# Altium schematic sheet THREE PHASES.SchDoc
size A4; SheetNumber: 2; SheetTotal: 6
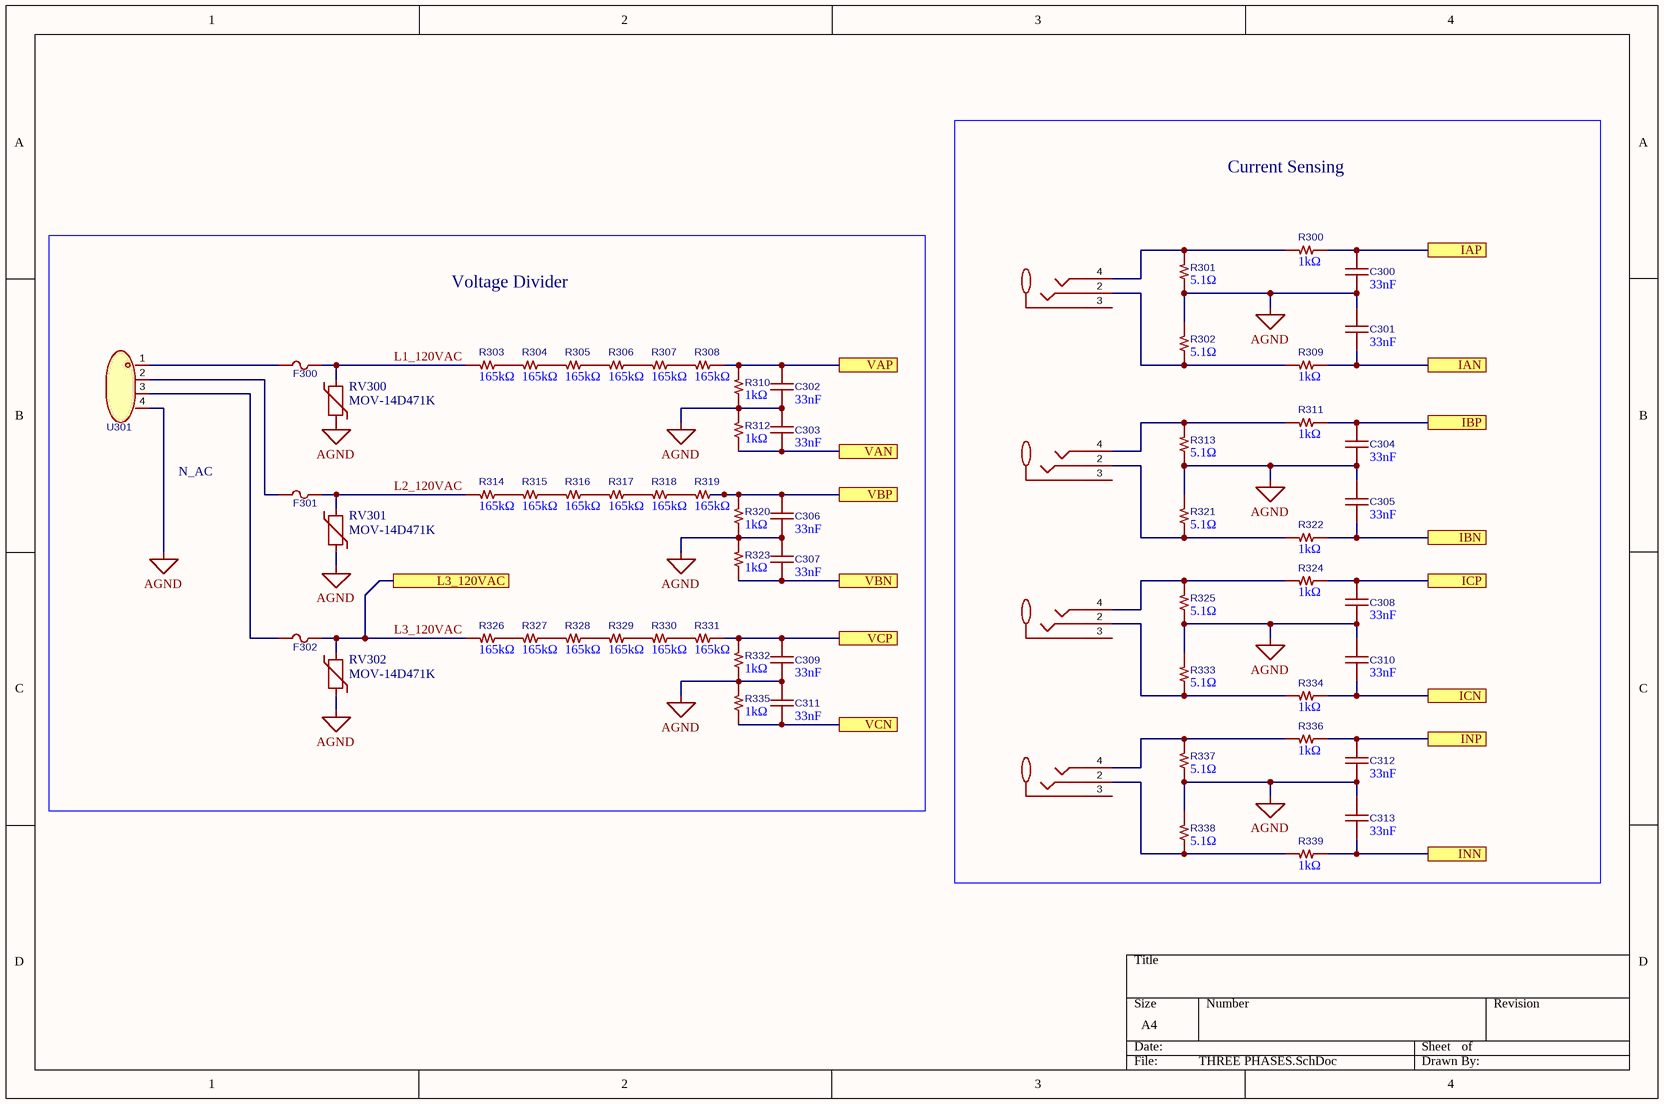
[diagram p0: THREE PHASES.SchDoc]

## Parts
C300  value 33nF  [0603_cap]  (hidden comment: AIDE CAPACITOR 0603X7R333J500NT)
C301  value 33nF  [0603_cap]  (hidden comment: AIDE CAPACITOR 0603X7R333J500NT)
C302  value 33nF  [0603_cap]  (hidden comment: AIDE CAPACITOR 0603X7R333J500NT)
C303  value 33nF  [0603_cap]  (hidden comment: AIDE CAPACITOR 0603X7R333J500NT)
C304  value 33nF  [0603_cap]  (hidden comment: AIDE CAPACITOR 0603X7R333J500NT)
C305  value 33nF  [0603_cap]  (hidden comment: AIDE CAPACITOR 0603X7R333J500NT)
C306  value 33nF  [0603_cap]  (hidden comment: AIDE CAPACITOR 0603X7R333J500NT)
C307  value 33nF  [0603_cap]  (hidden comment: AIDE CAPACITOR 0603X7R333J500NT)
C308  value 33nF  [0603_cap]  (hidden comment: AIDE CAPACITOR 0603X7R333J500NT)
C309  value 33nF  [0603_cap]  (hidden comment: AIDE CAPACITOR 0603X7R333J500NT)
C310  value 33nF  [0603_cap]  (hidden comment: AIDE CAPACITOR 0603X7R333J500NT)
C311  value 33nF  [0603_cap]  (hidden comment: AIDE CAPACITOR 0603X7R333J500NT)
C312  value 33nF  [0603_cap]  (hidden comment: AIDE CAPACITOR 0603X7R333J500NT)
C313  value 33nF  [0603_cap]  (hidden comment: AIDE CAPACITOR 0603X7R333J500NT)
F300  JDTfuse JFC2410-0200TS  [FUSE-SMD_L6.1-W2.7]  (value not drawn)
F301  JDTfuse JFC2410-0200TS  [FUSE-SMD_L6.1-W2.7]  (value not drawn)
F302  JDTfuse JFC2410-0200TS  [FUSE-SMD_L6.1-W2.7]  (value not drawn)
R300  value 1kΩ  [0603_RES]  (hidden comment: FOJAN FRC0603F1001TS)
R301  value 5.1Ω  [0603_RES]  (hidden comment: SEI(Stackpole Electronics Inc.))
R302  value 5.1Ω  [0603_RES]  (hidden comment: SEI(Stackpole Electronics Inc.))
R303  value 165kΩ  [0603_RES]  (hidden comment: BOURNS CR0603-FX-1653ELF)
R304  value 165kΩ  [0603_RES]  (hidden comment: BOURNS CR0603-FX-1653ELF)
R305  value 165kΩ  [0603_RES]  (hidden comment: BOURNS CR0603-FX-1653ELF)
R306  value 165kΩ  [0603_RES]  (hidden comment: BOURNS CR0603-FX-1653ELF)
R307  value 165kΩ  [0603_RES]  (hidden comment: BOURNS CR0603-FX-1653ELF)
R308  value 165kΩ  [0603_RES]  (hidden comment: BOURNS CR0603-FX-1653ELF)
R309  value 1kΩ  [0603_RES]  (hidden comment: FOJAN FRC0603F1001TS)
R310  value 1kΩ  [0603_RES]  (hidden comment: FOJAN FRC0603F1001TS)
R311  value 1kΩ  [0603_RES]  (hidden comment: FOJAN FRC0603F1001TS)
R312  value 1kΩ  [0603_RES]  (hidden comment: FOJAN FRC0603F1001TS)
R313  value 5.1Ω  [0603_RES]  (hidden comment: SEI(Stackpole Electronics Inc.))
R314  value 165kΩ  [0603_RES]  (hidden comment: BOURNS CR0603-FX-1653ELF)
R315  value 165kΩ  [0603_RES]  (hidden comment: BOURNS CR0603-FX-1653ELF)
R316  value 165kΩ  [0603_RES]  (hidden comment: BOURNS CR0603-FX-1653ELF)
R317  value 165kΩ  [0603_RES]  (hidden comment: BOURNS CR0603-FX-1653ELF)
R318  value 165kΩ  [0603_RES]  (hidden comment: BOURNS CR0603-FX-1653ELF)
R319  value 165kΩ  [0603_RES]  (hidden comment: BOURNS CR0603-FX-1653ELF)
R320  value 1kΩ  [0603_RES]  (hidden comment: FOJAN FRC0603F1001TS)
R321  value 5.1Ω  [0603_RES]  (hidden comment: SEI(Stackpole Electronics Inc.))
R322  value 1kΩ  [0603_RES]  (hidden comment: FOJAN FRC0603F1001TS)
R323  value 1kΩ  [0603_RES]  (hidden comment: FOJAN FRC0603F1001TS)
R324  value 1kΩ  [0603_RES]  (hidden comment: FOJAN FRC0603F1001TS)
R325  value 5.1Ω  [0603_RES]  (hidden comment: SEI(Stackpole Electronics Inc.))
R326  value 165kΩ  [0603_RES]  (hidden comment: BOURNS CR0603-FX-1653ELF)
R327  value 165kΩ  [0603_RES]  (hidden comment: BOURNS CR0603-FX-1653ELF)
R328  value 165kΩ  [0603_RES]  (hidden comment: BOURNS CR0603-FX-1653ELF)
R329  value 165kΩ  [0603_RES]  (hidden comment: BOURNS CR0603-FX-1653ELF)
R330  value 165kΩ  [0603_RES]  (hidden comment: BOURNS CR0603-FX-1653ELF)
R331  value 165kΩ  [0603_RES]  (hidden comment: BOURNS CR0603-FX-1653ELF)
R332  value 1kΩ  [0603_RES]  (hidden comment: FOJAN FRC0603F1001TS)
R333  value 5.1Ω  [0603_RES]  (hidden comment: SEI(Stackpole Electronics Inc.))
R334  value 1kΩ  [0603_RES]  (hidden comment: FOJAN FRC0603F1001TS)
R335  value 1kΩ  [0603_RES]  (hidden comment: FOJAN FRC0603F1001TS)
R336  value 1kΩ  [0603_RES]  (hidden comment: FOJAN FRC0603F1001TS)
R337  value 5.1Ω  [0603_RES]  (hidden comment: SEI(Stackpole Electronics Inc.))
R338  value 5.1Ω  [0603_RES]  (hidden comment: SEI(Stackpole Electronics Inc.))
R339  value 1kΩ  [0603_RES]  (hidden comment: FOJAN FRC0603F1001TS)
RV300  MOV-14D471K  [MOV14D471K]
RV301  MOV-14D471K  [MOV14D471K]
RV302  MOV-14D471K  [MOV14D471K]
U300  hx pj-320a-3p dip  [AUDIO-SMD_HX-PJ-320A-3P-DIP]  (value not drawn)
U301  c50126v-4p0g56  [CONN-TH_C50126V-4P0G56]  (value not drawn)
U302  hx pj-320a-3p dip  [AUDIO-SMD_HX-PJ-320A-3P-DIP]  (value not drawn)
U303  hx pj-320a-3p dip  [AUDIO-SMD_HX-PJ-320A-3P-DIP]  (value not drawn)
U304  hx pj-320a-3p dip  [AUDIO-SMD_HX-PJ-320A-3P-DIP]  (value not drawn)

## Blocks framed on the sheet
Current Sensing: C300 C301 C304 C305 C308 C310 C312 C313 R300-R302 R309 R311 R313 R321 R322 R324 R325 R333 R334 R336-R339 U300 U302-U304
Voltage Divider: C302 C303 C306 C307 C309 C311 F300-F302 R303-R308 R310 R312 R314-R320 R323 R326-R332 R335 RV300-RV302 U301

## Ports
IAN (see MAIN[1C], MEASURES[1C]), IAP (see MAIN[1C], MEASURES[1C]), IBN (see MAIN[1C], MEASURES[1C]), IBP (see MAIN[1C], MEASURES[1C]), ICN (see MAIN[1C], MEASURES[1C]), ICP (see MAIN[1C], MEASURES[1C]), INN (see MAIN[1C], MEASURES[1C]), INP (see MAIN[1C], MEASURES[1C]), L3_120VAC (see MAIN[1B], POWER[1B]), VAN (see MAIN[1B], MEASURES[1C]), VAP (see MAIN[1B], MEASURES[1C]), VBN (see MAIN[1B], MEASURES[1C]), VBP (see MAIN[1B], MEASURES[1C]), VCN (see MAIN[1B], MEASURES[1C]), VCP (see MAIN[1B], MEASURES[1C])

## Nets
AGND: C300.1 C301.2 C302.1 C303.2 C304.1 C305.2 C306.1 C307.2 C308.1 C309.1 C310.2 C311.2 C312.1 C313.2 R301.1 R302.2 R310.1 R312.2 R313.1 R320.1 R321.2 R323.2 R325.1 R332.1 R333.2 R335.2 R337.1 R338.2 RV300.2 RV301.2 RV302.2 U301.4
IAN: C301.1 R309.1 ; port IAN
IAP: C300.2 R300.1 ; port IAP
IBN: C305.1 R322.1 ; port IBN
IBP: C304.2 R311.1 ; port IBP
ICN: C310.1 R334.1 ; port ICN
ICP: C308.2 R324.1 ; port ICP
INN: C313.1 R339.1 ; port INN
INP: C312.2 R336.1 ; port INP
L1_120VAC: F300.2 R303.2 RV300.1
L2_120VAC: F301.2 R314.2 RV301.1
L3_120VAC: F302.2 R326.2 RV302.1 ; port L3_120VAC
VAN: C303.1 R312.1 ; port VAN
VAP: C302.2 R308.1 R310.2 ; port VAP
VBN: C307.1 R323.1 ; port VBN
VBP: C306.2 R319.1 R320.2 ; port VBP
VCN: C311.1 R335.1 ; port VCN
VCP: C309.2 R331.1 R332.2 ; port VCP
NetF300_1: F300.1 U301.1
NetF301_1: F301.1 U301.2
NetF302_1: F302.1 U301.3
NetR300_2: R300.2 R301.2 U300.4
NetR302_1: R302.1 R309.2 U300.2
NetR303_1: R303.1 R304.2
NetR304_1: R304.1 R305.2
NetR305_1: R305.1 R306.2
NetR306_1: R306.1 R307.2
NetR307_1: R307.1 R308.2
NetR311_2: R311.2 R313.2 U302.4
NetR314_1: R314.1 R315.2
NetR315_1: R315.1 R316.2
NetR316_1: R316.1 R317.2
NetR317_1: R317.1 R318.2
NetR318_1: R318.1 R319.2
NetR321_1: R321.1 R322.2 U302.2
NetR324_2: R324.2 R325.2 U303.4
NetR326_1: R326.1 R327.2
NetR327_1: R327.1 R328.2
NetR328_1: R328.1 R329.2
NetR329_1: R329.1 R330.2
NetR330_1: R330.1 R331.2
NetR333_1: R333.1 R334.2 U303.2
NetR336_2: R336.2 R337.2 U304.4
NetR338_1: R338.1 R339.2 U304.2

Not connected (* = marked no-connect by the designer): U300 3; U302 3; U303 3; U304 3

## Notes on the sheet
- N_AC

## Library data of the parts
C300-C313 = CAP_CER_33nF X7R ±5% 50V: 33nF X7R ±5% 50V 0603 Ceramic Capacitors RoHS; ComponentLink1Description: LCSC; ComponentLink1URL: https://www.lcsc.com/product-detail/C49326639.html?s_z=n_q_AIDE%2520CAPACITOR%25200603X7R333J500NT&spm=wm.fly.bg.0.xh&lcsc_vid=FFRdVwAETgNbVwAHTlRdV1UFEwcIU1ZXQVZZAlYFQAcxVlNfRlJdU1VSRlReXjsOAxUeFF5JWBYZEEoKFBINSQcJGk4LFEsFFhULAAsUDk5fVl1fWQkaCgg%3D; Supplier 1: LCSC; Manufacturer 1: AIDE CAPACITOR; Manufacturer Part Number 1: 0603X7R333J500NT; Supplier Part Number 1: C49326639
F300-F302 = FUSE_MOV_JFC2410: Surface Mount Fuse 200mA 250V 2410 Fuses; ComponentLink1Description: LCSC; ComponentLink1URL: https://www.lcsc.com/product-detail/C55058769.html?s_z=n_q_JFC2410-0200TS; Supplier 1: LCSC; Supplier Part Number 1: C55058769; Manufacturer 1: JDTfuse; Manufacturer Part Number 1: JFC2410-0200TS
R300 R309-R312 R320 R322-R324 R332 R334-R336 R339 = RES 1kohms ±1% 100mW 0603: RES 1kΩ ±1% 100mW 0603; ComponentLink1Description: New link; ComponentLink1URL: https://www.lcsc.com/es/product-detail/C2907002.html?spm=wm.fly.bg.1.xh___wm.fly.dhl.mly.13-6-1&lcsc_vid=T1EMUlBeR1ALUlVSFANeUFcFR1BWV1EHFVFaA1dQElAxVlNfRlJaV1FUQldbXzsOAxUeFF5JWBYZEEoKFBINSQcJGk4NBhYS; Supplier 1: LCSC; Supplier Part Number 1: C2907002; Manufacturer Part Number 1: FRC0603F1001TS; Manufacturer 1: FOJAN
R301 R302 R313 R321 R325 R333 R337 R338 = RES 5.1ohms ±1% 400mW 0603: RES 5.1Ω ±1% 400mW 0603; Manufacturer 1: UNI-ROYAL HQ03W5F510KT5E; Manufacturer Part Number 1: HQ03W5F510KT5E; Supplier Part Number 1: C2791987; Supplier 1: LCSC; ComponentLink1Description: New link; ComponentLink1URL: https://www.lcsc.com/es/product-detail/C2907011.html?spm=wm.fly.bg.0.xh___wm.fly.tp.1.ml&lcsc_vid=TlUKUVJeQVYNVVcAFQBcBQJfRlgPUVYCQllYVwUHEQcxVlNfRFRfUVJUQ1JcXzsOAxUeFF5JWBYZEEoKFBINSQcJGk4LFEs%3D
R303-R308 R314-R319 R326-R331 = RES 165k ±0.1% 100mW 0603: RES 165kΩ ±0.1% 100mW 0603; Manufacturer 1: YAGEO; Manufacturer Part Number 1: RT0603BRD07165KL; ComponentLink1Description: New link; ComponentLink1URL: https://www.lcsc.com/product-detail/C861150.html; Supplier Part Number 1: C861150; Supplier 1: LCSC
RV300-RV302 = MOV-14D471K: 470 V 4.5 kA Varistor 1 Circuit Through Hole Disc 14mm; Manufacturer 1: BOURNS; ComponentLink1Description: LCSC; ComponentLink1URL: https://www.lcsc.com/es/product-detail/C1527439.html?s_z=n_q_MOV-14D471K&spm=wm.fly.bg.0.xh&lcsc_vid=FFRdVwAETgNbVwAHTlRdV1UFEwcIU1ZXQVZZAlYFQAcxVlNfRlJdUlZRQlZXVjsOAxUeFF5JWBYZEEoKFBINSQcJGk4LFEsWBQ4KEgcSWgULEwUPG04tUlNXRlhYSQwSGg0%3D; Supplier 1: LCSC; Supplier Part Number 1: C1527439; ComponentLink2Description: Datasheet; ComponentLink2URL: https://www.lcsc.com/datasheet/C1527439.pdf; Manufacturer Part Number 1: MOV-14D471K
U300 U302-U304 = hx pj-320a-3p dip: Connector Type:3.5mm Headphone Jack Current Rating:500mA Voltage Rating (Max):30V Operating Temperature:-30℃~+70℃ Operating Temperature:-30℃~+70℃ Rank Number:TRS Mounting Style:Right-Angle Body Height:5mm Length:14.1mm Width:6mm; Manufacturer 1: hanxia; ComponentLink1Description: LCSC; ComponentLink1URL: https://www.lcsc.com/product-detail/C19189087.html?s_z=n_q_hx%2520pj-320a-3p%2520dip; Supplier 1: LCSC; Supplier Part Number 1: C19189087; Manufacturer Part Number 1: HX PJ-320A-3P DIP
U301 = BR_50126v-4p0g56: Number of Positions or Pins:1x4P Pitch:5mm Color:Green Mounting Type:Through Hole Number of Pins:4P Number of Rows:1 Number of PINs Per Row:4 Current Rating:18A Voltage Rating (Max):250V Wire Gauge - AWG:14~26 Wire Gauge - mm2:0.5~2.5 Wire Gauge - mm2:0.5; Manufacturer 1: JXTCONN; Color: Green; ComponentLink1Description: LCSC; ComponentLink1URL: https://www.lcsc.com/es/product-detail/C49291885.html?spm=wm.fly.bg.2.xh&lcsc_vid=QARXAVUEQ1ELXl1fE1ZXXgVfFgdaUV1TRAUKVFNRFFAxVlNfRlVdU1NQQFdcUTtW; Supplier 1: LCSC; Supplier Part Number 1: C49291885; Manufacturer Part Number 1: C50126V-4P0G56